# Altium schematic sheet A3x3.SchDoc: название платы
size 891 x 420 mm; ApprovedBy: Рогов; CheckedBy: Фамилия проверяющего; DrawnBy: Фамилия разработчика; DocumentNumber: Введите номер платы + Э3; SheetNumber: пусто если листов 1, иначе 1; SheetTotal: количество листов; Title1str: дополнительная строка при необходимости; DocumentType: тип схемы; Format: A3x3; ImagePath: Введите номер платы
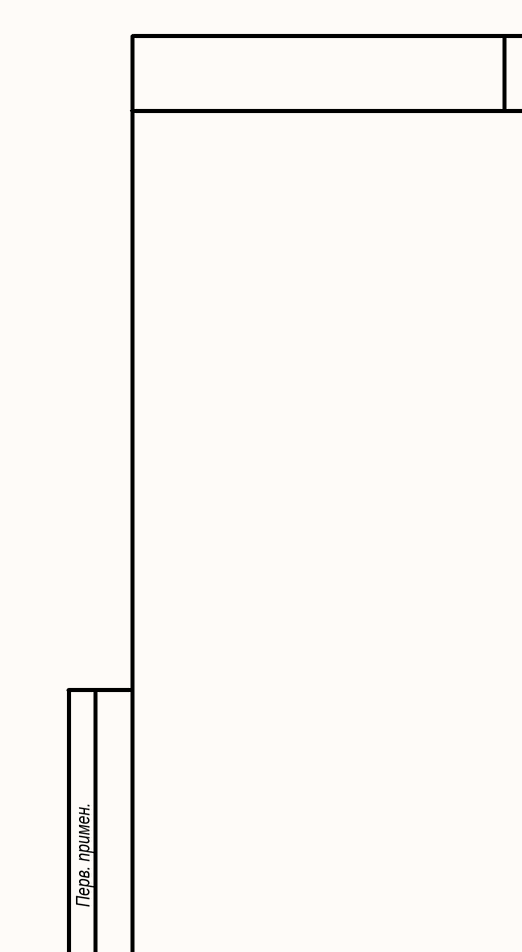
[diagram p0: A3x3.SchDoc, top left]
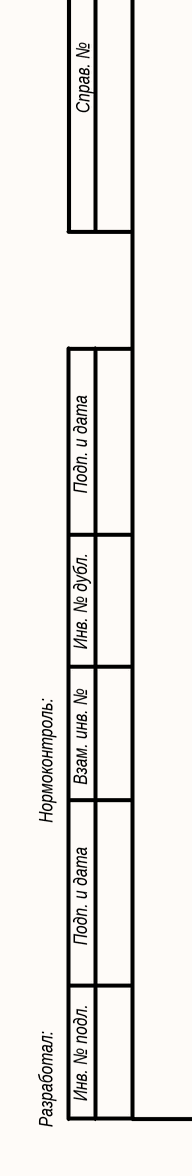
[diagram p1: A3x3.SchDoc, bottom left]
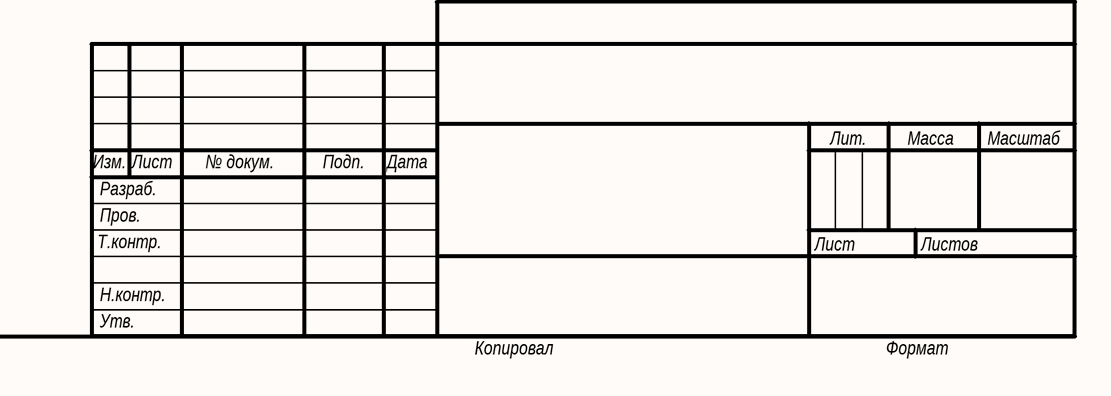
[diagram p2: A3x3.SchDoc, bottom right]

## Notes on the sheet
- Перв. примен.
- Справ. №
- Подп. и дата
- Инв. № дубл.
- Нормоконтроль:
- Взам. инв. №
- Изм.
- Лист
- № докум.
- Подп.
- Дата
- Лит.
- Масса
- Масштаб
- Т.контр.
- Пров.
- Разраб.
- Листов
- Разработал:
- Инв. № подл.
- Н.контр.
- Утв.
- Копировал
- Формат